# Altium project Industrial_Gateway_Academic.PrjPcb (part 1 of 2)
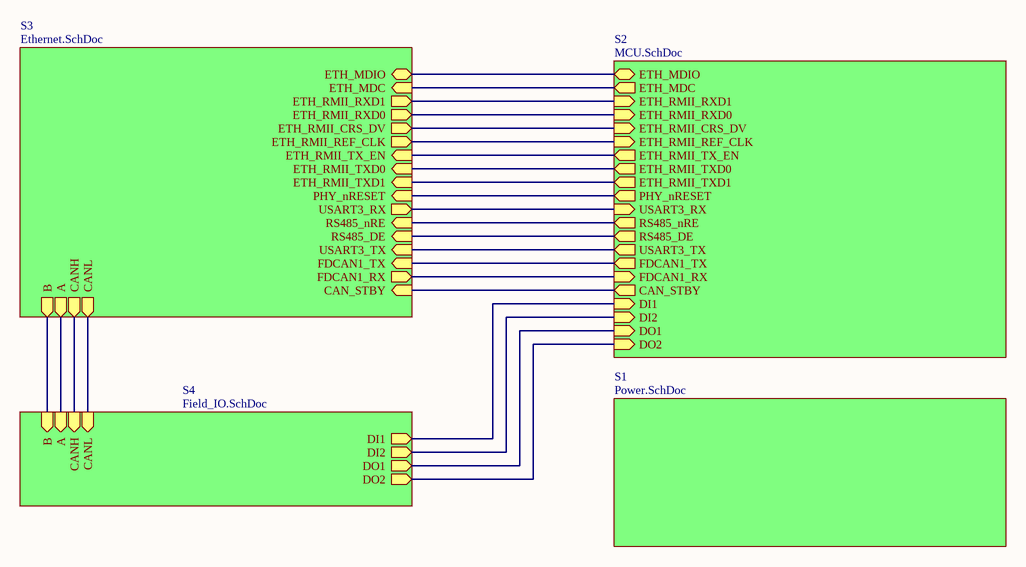
[diagram p0: TopLevel.SchDoc]
5 sheets, 136 parts. Net scope: hierarchical (ports join the sheet entries above them; power ports are global).
Board file: PCB1.PcbDoc
Sheets:
  TopLevel.SchDoc
    S2 = MCU.SchDoc
    S4 = Field_IO.SchDoc
    S3 = Ethernet.SchDoc
    S1 = Power.SchDoc

## Sheet TopLevel.SchDoc
size A

### Sub-sheets
S1 = Power.SchDoc: no entries
S2 = MCU.SchDoc: ETH_MDIO (bidir), ETH_MDC (out), ETH_RMII_RXD1 (in), ETH_RMII_RXD0 (in), ETH_RMII_CRS_DV (in), ETH_RMII_REF_CLK (in), ETH_RMII_TX_EN (out), ETH_RMII_TXD0 (out), ETH_RMII_TXD1 (out), PHY_nRESET (out), USART3_RX (in), RS485_nRE (out), RS485_DE (out), USART3_TX (out), FDCAN1_TX (out), FDCAN1_RX (in), CAN_STBY (out), DI1 (in), DI2 (in), DO1 (in), DO2 (in)
S3 = Ethernet.SchDoc: ETH_MDIO (bidir), ETH_MDC (in), ETH_RMII_RXD1 (out), ETH_RMII_RXD0 (out), ETH_RMII_CRS_DV (out), ETH_RMII_REF_CLK (out), ETH_RMII_TX_EN (in), ETH_RMII_TXD0 (in), ETH_RMII_TXD1 (in), PHY_nRESET (in), USART3_RX (out), RS485_nRE (in), RS485_DE (in), USART3_TX (in), FDCAN1_TX (in), FDCAN1_RX (out), CAN_STBY (in), B (out), A (out), CANH (out), CANL (out)
S4 = Field_IO.SchDoc: DI1 (out), DI2 (out), DO1 (out), DO2 (out), B (in), A (in), CANH (in), CANL (in)

### Nets
NetD4_1: sheet S4/B, sheet S3/B
NetD4_2: sheet S4/A, sheet S3/A
NetJ10_1: sheet S4/CANH, sheet S3/CANH
NetJ10_2: sheet S4/CANL, sheet S3/CANL
NetR16_1: sheet S2/RS485_nRE, sheet S3/RS485_nRE
NetR18_2: sheet S2/RS485_DE, sheet S3/RS485_DE
NetR24_2: sheet S2/DO1, sheet S4/DO1
NetR30_2: sheet S2/DO2, sheet S4/DO2
NetU4_3: sheet S2/DI1, sheet S4/DI1
NetU4_4: sheet S2/DI2, sheet S4/DI2
NetU4_5: sheet S2/PHY_nRESET, sheet S3/PHY_nRESET
NetU4_16: sheet S2/ETH_MDC, sheet S3/ETH_MDC
NetU4_23: sheet S2/ETH_RMII_REF_CLK, sheet S3/ETH_RMII_REF_CLK
NetU4_24: sheet S2/ETH_MDIO, sheet S3/ETH_MDIO
NetU4_31: sheet S2/ETH_RMII_CRS_DV, sheet S3/ETH_RMII_CRS_DV
NetU4_32: sheet S2/ETH_RMII_RXD0, sheet S3/ETH_RMII_RXD0
NetU4_33: sheet S2/ETH_RMII_RXD1, sheet S3/ETH_RMII_RXD1
NetU4_37: sheet S2/CAN_STBY, sheet S3/CAN_STBY
NetU4_47: sheet S2/ETH_RMII_TX_EN, sheet S3/ETH_RMII_TX_EN
NetU4_51: sheet S2/ETH_RMII_TXD0, sheet S3/ETH_RMII_TXD0
NetU4_52: sheet S2/ETH_RMII_TXD1, sheet S3/ETH_RMII_TXD1
NetU4_55: sheet S2/USART3_TX, sheet S3/USART3_TX
NetU4_56: sheet S2/USART3_RX, sheet S3/USART3_RX
NetU4_81: sheet S2/FDCAN1_RX, sheet S3/FDCAN1_RX
NetU4_82: sheet S2/FDCAN1_TX, sheet S3/FDCAN1_TX

## Sheet MCU.SchDoc
size A4
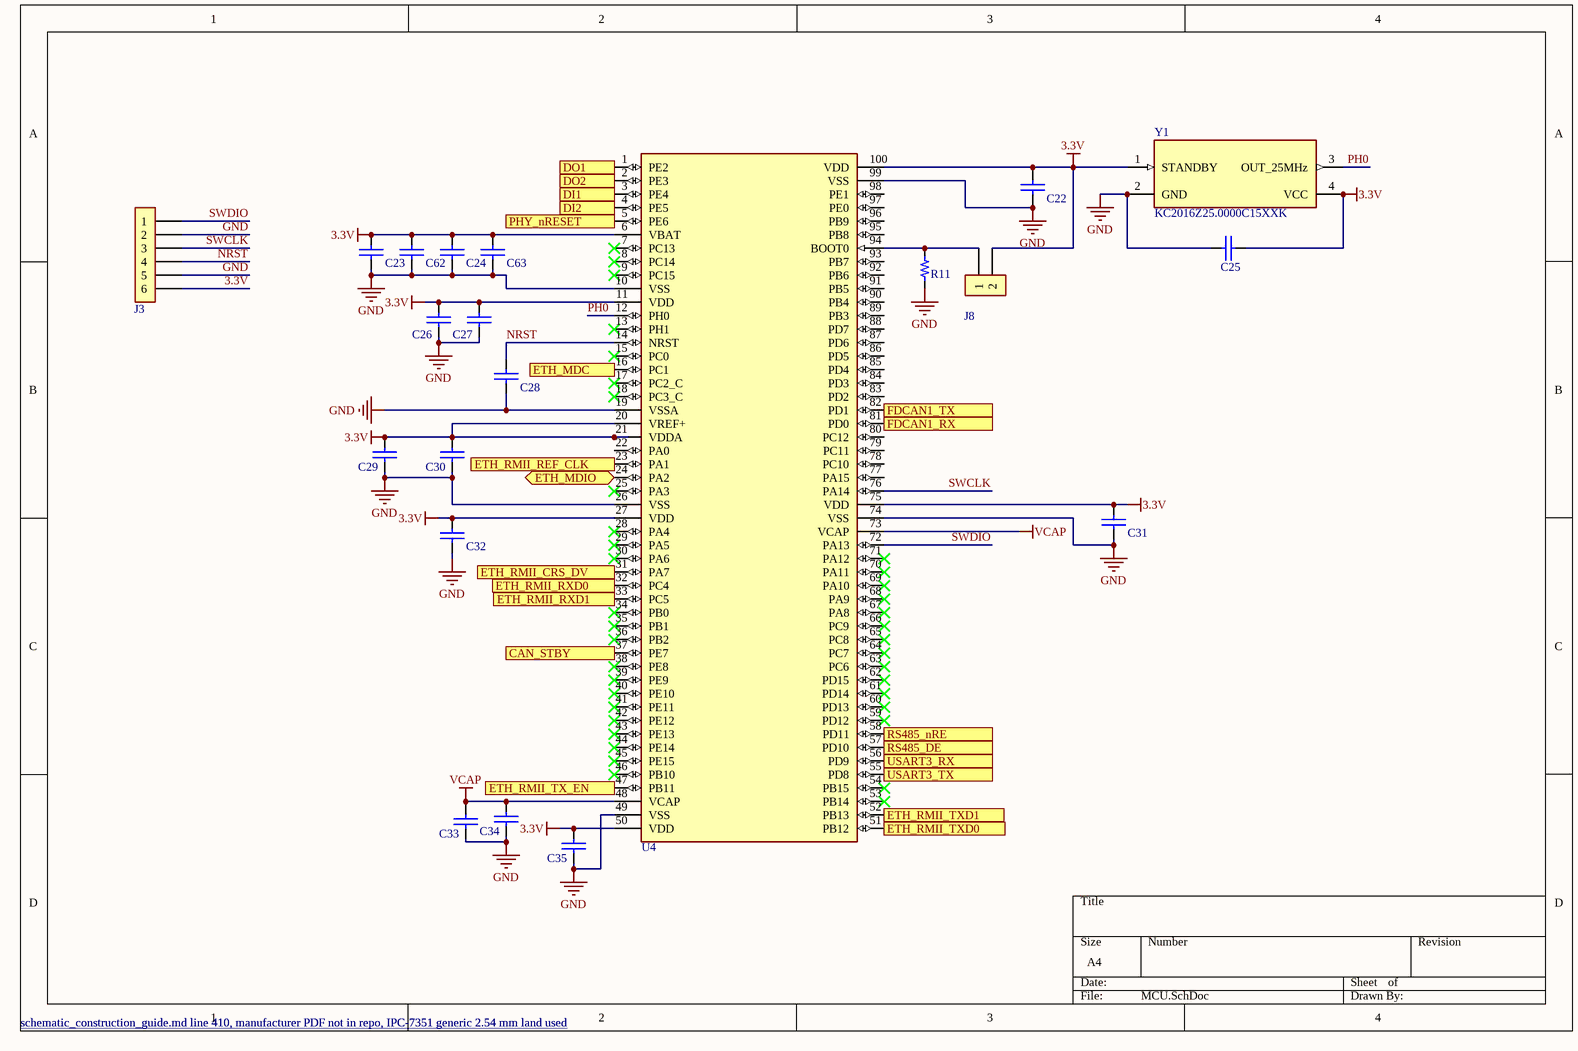
[diagram p1: MCU.SchDoc]

### Parts
C22  100 nF  [GW_0603_KEMET_NOMINAL]  (value not drawn)
C23  1 uF  [GW_SAMSUNG_CL10_1608_REFLOW]  (value not drawn)
C24  100 nF  [GW_0603_KEMET_NOMINAL]  (value not drawn)
C25  10 nF  [GW_0603_KEMET_NOMINAL]  (value not drawn)
C26  100 nF  [GW_0603_KEMET_NOMINAL]  (value not drawn)
C27  4.7 uF  [GW_0805_KEMET_NOMINAL]  (value not drawn)
C28  100 nF  [GW_0603_KEMET_NOMINAL]  (value not drawn)
C29  1 uF  [GW_SAMSUNG_CL10_1608_REFLOW]  (value not drawn)
C30  100 nF  [GW_0603_KEMET_NOMINAL]  (value not drawn)
C31  100 nF  [GW_0603_KEMET_NOMINAL]  (value not drawn)
C32  100 nF  [GW_0603_KEMET_NOMINAL]  (value not drawn)
C33  2.2 uF  [GW_0603_KEMET_NOMINAL]  (value not drawn)
C34  2.2 uF  [GW_0603_KEMET_NOMINAL]  (value not drawn)
C35  100 nF  [GW_0603_KEMET_NOMINAL]  (value not drawn)
C62  1 uF  [GW_SAMSUNG_CL10_1608_REFLOW]  (value not drawn)
C63  100 nF  [GW_0603_KEMET_NOMINAL]  (value not drawn)
J3  Source: schematic_construction_guide.md line 410, manufacturer PDF not in repo, IPC-7351 generic 2.54 mm land used  [GW_WRPHD_6X1_254_WURTH]  (hidden comment: 6 posiciones)
J8  Source: schematic_construction_guide.md line 410, manufacturer PDF not in repo, IPC-7351 generic 2.54 mm land used  [GW_WRPHD_2X1_254_WURTH]  (hidden comment: 2 posiciones)
R11  10 kOhm  [GW_RC0603_YAGEO_REFLOW]  (value not drawn)
U4  STM32H723VET6  [GW_LQFP100_ST_1L]  (value not drawn)
Y1  KC2016Z25.0000C15XXK  [GW_KC2016Z_KYOCERA]

### Ports
CAN_STBY (out), DI1 (in), DI2 (in), DO1 (in), DO2 (in), ETH_MDC (out), ETH_MDIO (bidir), ETH_RMII_CRS_DV (in), ETH_RMII_REF_CLK (in), ETH_RMII_RXD0 (in), ETH_RMII_RXD1 (in), ETH_RMII_TX_EN (out), ETH_RMII_TXD0 (out), ETH_RMII_TXD1 (out), FDCAN1_RX (in), FDCAN1_TX (out), PHY_nRESET (out), RS485_DE (out), RS485_nRE (out), USART3_RX (in), USART3_TX (out)

### Nets
3.3V: C22.1 C23.1 C24.1 C25.2 C26.1 C27.1 C29.1 C30.1 C31.1 C32.1 C35.1 C62.1 C63.1 J3.6 J8.2 U4.6(VBAT) U4.11(VDD) U4.20(VREF+) U4.21(VDDA) U4.27(VDD) U4.50(VDD) U4.75(VDD) U4.100(VDD) Y1.1(STANDBY) Y1.4(VCC)
GND: C22.2 C23.2 C24.2 C25.1 C26.2 C27.2 C28.2 C29.2 C30.2 C31.2 C32.2 C33.2 C34.2 C35.2 C62.2 C63.2 J3.2 J3.5 R11.2 U4.10(VSS) U4.19(VSSA) U4.26(VSS) U4.49(VSS) U4.74(VSS) U4.99(VSS) Y1.2(GND)
VCAP: C33.1 C34.1 U4.48(VCAP) U4.73(VCAP)
NRST: C28.1 J3.4 U4.14(NRST)
PH0: U4.12(PH0) Y1.3(OUT_25MHz)
SWCLK: J3.3 U4.76(PA14)
SWDIO: J3.1 U4.72(PA13)
NetJ8_1: J8.1 R11.1 U4.94(BOOT0)
NetR16_1: U4.58(PD11) ; port RS485_nRE
NetR18_2: U4.57(PD10) ; port RS485_DE
NetR24_2: U4.1(PE2) ; port DO1
NetR30_2: U4.2(PE3) ; port DO2
NetU4_3: U4.3(PE4) ; port DI1
NetU4_4: U4.4(PE5) ; port DI2
NetU4_5: U4.5(PE6) ; port PHY_nRESET
NetU4_16: U4.16(PC1) ; port ETH_MDC
NetU4_23: U4.23(PA1) ; port ETH_RMII_REF_CLK
NetU4_24: U4.24(PA2) ; port ETH_MDIO
NetU4_31: U4.31(PA7) ; port ETH_RMII_CRS_DV
NetU4_32: U4.32(PC4) ; port ETH_RMII_RXD0
NetU4_33: U4.33(PC5) ; port ETH_RMII_RXD1
NetU4_37: U4.37(PE7) ; port CAN_STBY
NetU4_47: U4.47(PB11) ; port ETH_RMII_TX_EN
NetU4_51: U4.51(PB12) ; port ETH_RMII_TXD0
NetU4_52: U4.52(PB13) ; port ETH_RMII_TXD1
NetU4_55: U4.55(PD8) ; port USART3_TX
NetU4_56: U4.56(PD9) ; port USART3_RX
NetU4_81: U4.81(PD0) ; port FDCAN1_RX
NetU4_82: U4.82(PD1) ; port FDCAN1_TX

Not connected (* = marked no-connect by the designer): U4 7(PC13)* 8(PC14)* 9(PC15)* 13(PH1)* 15(PC0)* 17(PC2_C)* 18(PC3_C)* 22(PA0) 25(PA3)* 28(PA4)* 29(PA5)* 30(PA6)* 34(PB0)* 35(PB1)* 36(PB2)* 38(PE8)* 39(PE9)* 40(PE10)* 41(PE11)* 42(PE12)* 43(PE13)* 44(PE14)* 45(PE15)* 46(PB10)* 53(PB14)* 54(PB15)* 59(PD12)* 60(PD13)* 61(PD14)* 62(PD15)* 63(PC6)* 64(PC7)* 65(PC8)* 66(PC9)* 67(PA8)* 68(PA9)* 69(PA10)* 70(PA11)* 71(PA12)* 77(PA15) 78(PC10) 79(PC11) 80(PC12) 83(PD2) 84(PD3) 85(PD4) 86(PD5) 87(PD6) 88(PD7) 89(PB3) 90(PB4) 91(PB5) 92(PB6) 93(PB7) 95(PB8) 96(PB9) 97(PE0) 98(PE1)

### Library data of the parts
C22 C24 C26 C28 C30-C32 C35 C63 = GW_C0603C104K5RACTU_dc5e12a5: C0603C104K5RACTU; 100 nF; 50 V; X7R; -55..125 C; CAD_CANDIDATE; Manufacturer: KEMET; Tolerance: 10%; Electrical_Status: PROVISIONAL; CAD_Source: Professor_shared.SchLib glyph Cap_0.1uF_0603_50V; CAD_Limitations: Glyph pins/types inspected; exact manufacturer land-pattern/mask/paste qualification pending.; Electrical_Notes: Ficha KEMET local p1. Adaptar parametros; no usar el Y5V 0603F104Z500CT como equivalente. Modelo candidato existente; sin cotejo visual de pads/pines en Altium.; Manufacturer Part Number: C0603C104K5RACTU; Value: 100 nF; Rating: 50 V; X7R; -55..125 C; Power Rating: N/A; Package: 0603; CAD_Status: CAD_CANDIDATE
C23 C29 C62 = GW_CL10A105KB8NNNC_c3932faa: CL10A105KB8NNNC; 1 uF; 50 V; X5R; -55..85 C; CAD_CANDIDATE; Manufacturer: Samsung Electro-Mechanics; Tolerance: 10%; Electrical_Status: PROVISIONAL; CAD_Source: Professor_shared.SchLib glyph Cap_1uF_0603_50V; CAD_Limitations: Glyph pins/types inspected; exact manufacturer land-pattern/mask/paste qualification pending.; Electrical_Notes: Samsung ficha oficial; Ceff/ESR pendientes por aplicacion. Limite X5R 85 C: no homologado para ambiente superior. Modelo candidato existente; sin cotejo visual de pads/pines en Altium.; Manufacturer Part Number: CL10A105KB8NNNC; Value: 1 uF; Rating: 50 V; X5R; -55..85 C; Power Rating: N/A; Package: 0603; CAD_Status: CAD_CANDIDATE
C25 = GW_C0603C103K1RACTU_97f3ee33: C0603C103K1RACTU; 10 nF; 100 V; X7R; -55..125 C; CAD_CANDIDATE; Manufacturer: KEMET; Tolerance: 10%; Electrical_Status: PROVISIONAL; CAD_Source: Professor_shared.SchLib glyph Cap_0.1uF_0603_50V; CAD_Limitations: Glyph pins/types inspected; exact manufacturer land-pattern/mask/paste qualification pending.; Electrical_Notes: Ficha KEMET local DI_CIN p1; no confundir con externo CL10B103KA8WPNC 25 V. Modelo candidato existente; sin cotejo visual de pads/pines en Altium.; Manufacturer Part Number: C0603C103K1RACTU; Value: 10 nF; Rating: 100 V; X7R; -55..125 C; Power Rating: N/A; Package: 0603; CAD_Status: CAD_CANDIDATE
C27 = GW_C0805C475K4RACTU_82374e08: C0805C475K4RACTU; 4.7 uF; 16 V; X7R; CAD_CANDIDATE; Manufacturer: KEMET; Tolerance: 10%; Electrical_Status: PROVISIONAL; CAD_Source: Professor_shared.SchLib glyph Cap_10uF_0805_25V_; CAD_Limitations: Glyph pins/types inspected; exact manufacturer land-pattern/mask/paste qualification pending.; Electrical_Notes: Ceff a 3.3 V pendiente; no sustituir por 10 uF solo por disponibilidad. Modelo candidato existente; sin cotejo visual de pads/pines en Altium.; Manufacturer Part Number: C0805C475K4RACTU; Value: 4.7 uF; Rating: 16 V; X7R; Power Rating: N/A; Package: 0805; CAD_Status: CAD_CANDIDATE
C33 C34 = GW_C0603C225K8RACTU_46503424: C0603C225K8RACTU; 2.2 uF; 10 V; X7R; ESR <100 mOhm; CAD_CANDIDATE; Manufacturer: KEMET; Tolerance: 10% candidato; ST permite 20%; Electrical_Status: PROVISIONAL; CAD_Source: Professor_shared.SchLib glyph Cap_0.1uF_0603_50V; CAD_Limitations: Glyph pins/types inspected; exact manufacturer land-pattern/mask/paste qualification pending.; Electrical_Notes: Falta ESR y capacitancia bajo VCORE/temperatura/envejecimiento. No conectar 3.3 V ni carga externa a VCAP. Modelo candidato existente; sin cotejo visual de pads/pines en Altium.; Manufacturer Part Number: C0603C225K8RACTU; Value: 2.2 uF; Rating: 10 V; X7R; ESR <100 mOhm; Power Rating: N/A; Package: 0603; CAD_Status: CAD_CANDIDATE
J3 = GW_H_Male_6x1_TH_100mil_c0450d1e: TBD; 6 posiciones; TBD; CAD_CANDIDATE; Manufacturer: Wurth Elektronik; Manufacturer Part Number: 61300611121; Electrical_Status: PROVISIONAL; CAD_Source: Professor_shared.SchLib glyph H_Male_6x1_TH_100mil; CAD_Limitations: Glyph pins/types inspected; exact manufacturer land-pattern/mask/paste qualification pending.; Electrical_Notes: Pinout, MPN y orientacion pendientes. No alimentar VDD desde VTref; SWD PA13/PA14 y NRST. Modelo candidato existente; sin cotejo visual de pads/pines en Altium.; Value: 6 posiciones; Tolerance: TBD; Rating: TBD; Power Rating: N/A; Package: TBD; CAD_Status: CAD_CANDIDATE
J8 = GW_H_Male_2x1_TH_100mil_f89d9046: TBD; 2 posiciones; TBD; CAD_CANDIDATE; Manufacturer: Wurth Elektronik; Manufacturer Part Number: 61300211121; Electrical_Status: PROVISIONAL; CAD_Source: Professor_shared.SchLib glyph H_Male_2x1_TH_100mil; CAD_Limitations: Glyph pins/types inspected; exact manufacturer land-pattern/mask/paste qualification pending.; Electrical_Notes: Pinout, MPN y orientacion pendientes. No alimentar VDD desde VTref; SWD PA13/PA14 y NRST. Modelo candidato existente; sin cotejo visual de pads/pines en Altium.; Value: 2 posiciones; Tolerance: TBD; Rating: TBD; Power Rating: N/A; Package: TBD; CAD_Status: CAD_CANDIDATE
R11 = GW_FRC0603J103TS_7289f91d: FRC0603J103TS; 10 kOhm; >= 3.3 V; tension de trabajo por verificar; CAD_CANDIDATE; Manufacturer: FOJAN; Tolerance: 5%; Power Rating: 0.1 W; Electrical_Status: PROVISIONAL; CAD_Source: Professor_shared.SchLib glyph Res_10k_0603_1/10W; CAD_Limitations: Glyph pins/types inspected; exact manufacturer land-pattern/mask/paste qualification pending.; Electrical_Notes: Ratings transcritos del CAD; falta ficha FOJAN. Alternativa RC0603FR-0710KL con ficha oficial local, mismo footprint candidato. Modelo candidato existente; sin cotejo visual de pads/pines en Altium.; Manufacturer Part Number: FRC0603J103TS; Value: 10 kOhm; Rating: >= 3.3 V; tension de trabajo por verificar; Package: 0603; CAD_Status: CAD_CANDIDATE
U4 = STM32H723VET6: STM32H723VET6; CAD_CANDIDATE; GPIOs use bidirectional ERC type; oscillator pins have dedicated types. VCAP power pins are LDO outputs, never connect to VDD.; Manufacturer: STMicroelectronics; Electrical_Status: PROVISIONAL; CAD_Source: DS13313 Rev5 fig5, table7 pp57-71, fig65 p218 (PDF p219); Manufacturer Part Number: STM32H723VET6; Value: STM32H723VET6; CAD_Status: CAD_CANDIDATE; CAD_Limitations: GPIOs use bidirectional ERC type; oscillator pins have dedicated types. VCAP power pins are LDO outputs, never connect to VDD.
Y1 = KC2016Z25.0000C15XXK: Kyocera TNY1T-H1-DEX01-11 17-Jul-2026 pp4,6 table2 fig4; Two independent oscillators proposed; 10nF per supply. Tie1 to3V3. Load<=15pF and PHY phase-noise qualification pending.; CAD Status: CAD_CANDIDATE; Manufacturer: Kyocera; Manufacturer Part Number: KC2016Z25.0000C15XXK; Source: Kyocera TNY1T-H1-DEX01-11 17-Jul-2026 pp4,6 table2 fig4; Limitations: Two independent oscillators proposed; 10nF per supply. Tie1 to3V3. Load<=15pF and PHY phase-noise qualification pending.

## Sheet Field_IO.SchDoc
size A4
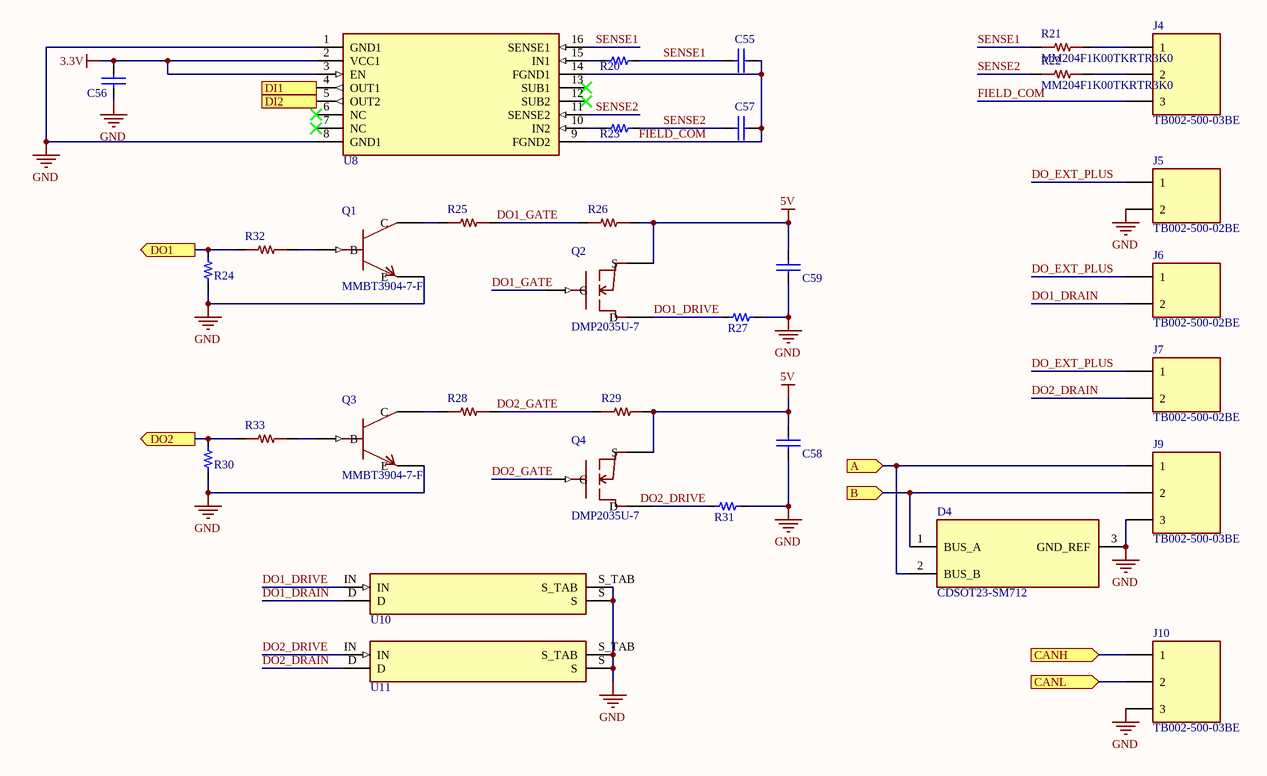
[diagram p2: Field_IO.SchDoc]

### Parts
C55  10 nF  [GW_0603_KEMET_NOMINAL]  (value not drawn)
C56  100 nF  [GW_0603_KEMET_NOMINAL]  (value not drawn)
C57  10 nF  [GW_0603_KEMET_NOMINAL]  (value not drawn)
C58  100 nF  [GW_0603_KEMET_NOMINAL]  (value not drawn)
C59  100 nF  [GW_0603_KEMET_NOMINAL]  (value not drawn)
D4  CDSOT23-SM712  [GW_SM712_BOURNS]
J4  TB002-500-03BE  [GW_TB002_500_3P_SAMESKY]
J5  TB002-500-02BE  [GW_TB002_500_2P_SAMESKY]
J6  TB002-500-02BE  [GW_TB002_500_2P_SAMESKY]
J7  TB002-500-02BE  [GW_TB002_500_2P_SAMESKY]
J9  TB002-500-03BE  [GW_TB002_500_3P_SAMESKY]
J10  TB002-500-03BE  [GW_TB002_500_3P_SAMESKY]
Q1  MMBT3904-7-F  [GW_MMBT3904_BEC_DIODES]
Q2  DMP2035U-7  [GW_DMP2035U_GSD_DIODES]
Q3  MMBT3904-7-F  [GW_MMBT3904_BEC_DIODES]
Q4  DMP2035U-7  [GW_DMP2035U_GSD_DIODES]
R20  562 Ohm  [GW_RC0603_YAGEO_REFLOW]  (value not drawn)
R21  MM204F1K00TKRTR3K0  [GW_MM204_FIRSTOHM]
R22  MM204F1K00TKRTR3K0  [GW_MM204_FIRSTOHM]
R23  562 Ohm  [GW_RC0603_YAGEO_REFLOW]  (value not drawn)
R24  10 kOhm  [GW_RC0603_YAGEO_REFLOW]  (value not drawn)
R25  RC0603FR-07100RL  [GW_RC0603_YAGEO_REFLOW]  (value not drawn)
R26  RC0603FR-074K7L  [GW_RC0603_YAGEO_REFLOW]  (value not drawn)
R27  2.49 kOhm  [GW_RC0603_YAGEO_REFLOW]  (value not drawn)
R28  RC0603FR-07100RL  [GW_RC0603_YAGEO_REFLOW]  (value not drawn)
R29  RC0603FR-074K7L  [GW_RC0603_YAGEO_REFLOW]  (value not drawn)
R30  10 kOhm  [GW_RC0603_YAGEO_REFLOW]  (value not drawn)
R31  2.49 kOhm  [GW_RC0603_YAGEO_REFLOW]  (value not drawn)
R32  RC0603FR-074K7L  [GW_RC0603_YAGEO_REFLOW]  (value not drawn)
R33  RC0603FR-074K7L  [GW_RC0603_YAGEO_REFLOW]  (value not drawn)
U8  ISO1212DBQR  [GW_DBQ0016A_TI]  (value not drawn)
U10  BSP75NTA  [GW_BSP75N_SOT223_DN_DIODES]  (value not drawn)
U11  BSP75NTA  [GW_BSP75N_SOT223_DN_DIODES]  (value not drawn)

### Ports
A (in), B (in), CANH (in), CANL (in), DI1 (out), DI2 (out), DO1 (out), DO2 (out)

### Nets
3.3V: C56.1 U8.2(VCC1) U8.3(EN)
5V: C58.1 C59.1 Q2.S Q4.S R26.2 R29.2
GND: C56.2 C58.2 C59.2 D4.3(GND_REF) J5.2 J9.3 J10.3 Q1.E Q3.E R24.1 R27.2 R30.1 R31.2 U8.1(GND1) U8.8(GND1) U10.S U10.S_TAB U11.S U11.S_TAB
DO1_DRAIN: J6.2 U10.D
DO1_DRIVE: Q2.D R27.1 U10.IN
DO1_GATE: Q2.G R25.2 R26.1
DO2_DRAIN: J7.2 U11.D
DO2_DRIVE: Q4.D R31.1 U11.IN
DO2_GATE: Q4.G R28.2 R29.1
DO_EXT_PLUS: J5.1 J6.1 J7.1
FIELD_COM: C55.2 C57.2 J4.3 U8.9(FGND2) U8.14(FGND1)
SENSE1: C55.1 R20.2 R21.1 U8.16(SENSE1)
SENSE2: C57.1 R22.1 R23.2 U8.11(SENSE2)
NetD4_1: D4.1(BUS_A) J9.2 ; port B
NetD4_2: D4.2(BUS_B) J9.1 ; port A
NetJ4_1: J4.1 R21.2
NetJ4_2: J4.2 R22.2
NetJ10_1: J10.1 ; port CANH
NetJ10_2: J10.2 ; port CANL
NetQ1_B: Q1.B R32.2
NetQ1_C: Q1.C R25.1
NetQ3_B: Q3.B R33.2
NetQ3_C: Q3.C R28.1
NetR20_1: R20.1 U8.15(IN1)
NetR23_1: R23.1 U8.10(IN2)
NetR24_2: R24.2 R32.1 ; port DO1
NetR30_2: R30.2 R33.1 ; port DO2
NetU4_3: U8.4(OUT1) ; port DI1
NetU4_4: U8.5(OUT2) ; port DI2

Not connected (* = marked no-connect by the designer): U8 6(NC)* 7(NC)* 12(SUB2)* 13(SUB1)*

### Library data of the parts
C55 C57 = GW_C0603C103K1RACTU_97f3ee33: as C25 on sheet MCU; Manufacturer Part Number: C0603C103K1RACTU; Value: 10 nF; Rating: 100 V; X7R; -55..125 C; Power Rating: N/A; Package: 0603; CAD_Status: CAD_CANDIDATE
C56 C58 C59 = GW_C0603C104K5RACTU_dc5e12a5: as C22 on sheet MCU; Manufacturer Part Number: C0603C104K5RACTU; Value: 100 nF; Rating: 50 V; X7R; -55..125 C; Power Rating: N/A; Package: 0603; CAD_Status: CAD_CANDIDATE
D4 = CDSOT23-SM712: Bourns CDSOT23-SM712 saved2026-11-07 pp1-2 pin diagram and Recommended Footprint; CAD mapping supported; no transferred 1kV surge rating for THVD1420. Populate only after protection qualification.; CAD Status: CAD_CANDIDATE; Manufacturer: Bourns; Manufacturer Part Number: CDSOT23-SM712; Source: Bourns CDSOT23-SM712 saved2026-11-07 pp1-2 pin diagram and Recommended Footprint; Limitations: CAD mapping supported; no transferred 1kV surge rating for THVD1420. Populate only after protection qualification.
J4 J9 J10 = TB002-500-03BE: Same Sky TB002-500 Rev1.04 09/12/2024 p1 order key,p2 PCB layout; project contact1left in PCBtopview with wire entry facing-Y;not manufacturer polarity; Manufacturer: Same Sky (formerly CUI Devices); Value: 3-pole5mm terminal block; CAD Status: CAD_VERIFIED_GEOMETRY;NATIVE_PLACEMENT_PENDING; Electrical Status: DERIVED_PENDING_REVIEW; Physical Mapping: Project-defined1left then+X in PCBtopview; wire-entryfront-Y. Confirm wire polarity against silk before bringup.; Manufacturer Part Number: TB002-500-03BE; Source: Same Sky TB002-500 Rev1.04 09/12/2024 p1 order key,p2 PCB layout; Datasheet: sources/autonomous_closure/tb002-500.pdf
J5-J7 = TB002-500-02BE: Same Sky TB002-500 Rev1.04 09/12/2024 p1 order key,p2 PCB layout; project contact1left in PCBtopview with wire entry facing-Y;not manufacturer polarity; Manufacturer: Same Sky (formerly CUI Devices); Value: 2-pole5mm terminal block; CAD Status: CAD_VERIFIED_GEOMETRY;NATIVE_PLACEMENT_PENDING; Electrical Status: DERIVED_PENDING_REVIEW; Physical Mapping: Project-defined1left then+X in PCBtopview; wire-entryfront-Y. Confirm wire polarity against silk before bringup.; Manufacturer Part Number: TB002-500-02BE; Source: Same Sky TB002-500 Rev1.04 09/12/2024 p1 order key,p2 PCB layout; Datasheet: sources/autonomous_closure/tb002-500.pdf
Q1 Q3 = MMBT3904-7-F: Diodes DS30036 Rev27-2 March2025 p1 top view/order, p3 electrical, p6 suggested lands; conventional NPN symbol; used in5V BSP input driver,NOT24V load path; Manufacturer: Diodes Incorporated; Value: NPN 40V200mA; CAD Status: CAD_VERIFIED_GEOMETRY;NATIVE_PLACEMENT_PENDING; Electrical Status: DERIVED_PENDING_REVIEW; Manufacturer Part Number: MMBT3904-7-F; Source: Diodes DS30036 Rev27-2 March2025 p1 top view/order, p3 electrical, p6 suggested lands; Datasheet: sources/autonomous_closure/MMBT3904.pdf; Terminal Mapping: Top view tab/lead above C/D; lower-left B/G; lower-right E/S; manufacturer functional IDs, no guessed numbers
Q2 Q4 = DMP2035U-7: Diodes DS31830 Rev11-2 June2025 p1 top view/order,p2 electrical,p6 suggested lands; conventional PMOS symbol; used in5V BSP input driver,NOT24V load path; Manufacturer: Diodes Incorporated; Value: PMOS20V;VGS±10V; CAD Status: CAD_VERIFIED_GEOMETRY;NATIVE_PLACEMENT_PENDING; Electrical Status: DERIVED_PENDING_REVIEW; Manufacturer Part Number: DMP2035U-7; Source: Diodes DS31830 Rev11-2 June2025 p1 top view/order,p2 electrical,p6 suggested lands; Datasheet: sources/autonomous_closure/DMP2035U.pdf; Terminal Mapping: Top view tab/lead above C/D; lower-left B/G; lower-right E/S; manufacturer functional IDs, no guessed numbers
R20 R23 = GW_RC0603FR-07562RL_a6fad8df: RC0603FR-07562RL; 562 Ohm; 75 V max; limite sqrt(P*R); CAD_CANDIDATE; Manufacturer: Yageo; Tolerance: 1%; Power Rating: 0.1 W @70 C; Electrical_Status: PROVISIONAL; CAD_Source: Professor_shared.SchLib glyph Res_10k_0603_1/10W; CAD_Limitations: Glyph pins/types inspected; exact manufacturer land-pattern/mask/paste qualification pending.; Electrical_Notes: Ityp2.25mA; P conservadora a2.75mA=4.30mW. No es resistor de24V completos; corriente de campo separada deVCC1. Modelo candidato existente; sin cotejo visual de pads/pines en Altium.; Manufacturer Part Number: RC0603FR-07562RL; Value: 562 Ohm; Rating: 75 V max; limite sqrt(P*R); Package: 0603; CAD_Status: CAD_CANDIDATE
R21 R22 = MM204F1K00TKRTR3K0: MM204F1K00TKRTR3K0; CAD_VERIFIED_GEOMETRY; Saved1.3x1.6landsatx+/-1.45mmmatchmanufacturerreflowtable. Nonpolar1/2projectmappingverified. NormalDIType3applicationonly;no500V/1kVsurgequalificationinferredfromMELFor0.25W. NativeDIresistornetsmustbecorrected.; Manufacturer: Firstohm; CAD Status: CAD_CANDIDATE; Limitations: 1kOhm1%,0.25W@70C, normal Type3 operation supported. 500V/1kV system surge withstand NOT established.; Manufacturer Part Number: MM204F1K00TKRTR3K0; Source: Firstohm MM rev08-March-2023 printedpp75-78, p78 reflow pad table MM16/MM204
R24 R30 = GW_FRC0603J103TS_7289f91d: as R11 on sheet MCU; Manufacturer Part Number: FRC0603J103TS; Value: 10 kOhm; Rating: >= 3.3 V; tension de trabajo por verificar; Package: 0603; CAD_Status: CAD_CANDIDATE
R25 R28 = RC0603FR-07100RL: RC0603FR-07100RL;1%0.1W75V0603; manufacturer RCseries ordering;Yageo mounting13Feb2018V10p4; Value: 100 Ohm; CAD Status: CAD_VERIFIED_GEOMETRY;NATIVE_PLACEMENT_PENDING; Electrical Status: DERIVED_PENDING_REVIEW;ORDER_CODE_FAMILY_SUPPORTED;EXACT_NOMINAL_SHEET_PENDING; Tolerance: 1%; Voltage Rating: 75V or sqrt(P*R),whichever lower; Power Rating: 0.1W at70C; Manufacturer: Yageo; Manufacturer Part Number: RC0603FR-07100RL; Source: Yageo RC0603 series order coding; Mounting13Feb2018V10 p4 Fig4/Table1; Package: 0603
R26 R29 R32 R33 = RC0603FR-074K7L: RC0603FR-074K7L;1%0.1W75V0603; manufacturer RCseries ordering;Yageo mounting13Feb2018V10p4; Value: 4.7 kOhm; CAD Status: CAD_VERIFIED_GEOMETRY;NATIVE_PLACEMENT_PENDING; Electrical Status: DERIVED_PENDING_REVIEW;ORDER_CODE_FAMILY_SUPPORTED;EXACT_NOMINAL_SHEET_PENDING; Tolerance: 1%; Voltage Rating: 75V or sqrt(P*R),whichever lower; Power Rating: 0.1W at70C; Manufacturer: Yageo; Manufacturer Part Number: RC0603FR-074K7L; Source: Yageo RC0603 series order coding; Mounting13Feb2018V10 p4 Fig4/Table1; Package: 0603
R27 R31 = GW_RC0603FR-072K49L_b905c5f0: RC0603FR-072K49L; 2.49 kOhm; 75 V max; limite sqrt(P*R); CAD_CANDIDATE; Manufacturer: Yageo; Tolerance: 1%; Power Rating: 0.1 W @70 C; CAD_Status: CAD_VERIFIED_SOURCE_LAND;NATIVE_INSTANCE_ECO_PENDING; Electrical_Status: PROVISIONAL; CAD_Source: Professor_shared.SchLib glyph Res_10k_0603_1/10W; CAD_Limitations: Same-manufacturer series mounting geometry verified; prototype mask/paste choices recorded. Electrical application limits unchanged. Native instance links/ECO pending.; Electrical_Notes: Candidato ENHANCED/RMII leader: ModeSelect NC, strap1=1 default, strap8=1, strap5=0 default. Ver tabla del informe; sin LEDs de straps. Modelo candidato existente; sin cotejo visual de pads/pines en Altium.; Manufacturer Part Number: RC0603FR-072K49L; Value: 2.49 kOhm; Rating: 75 V max; limite sqrt(P*R); Package: 0603
U8 = ISO1212DBQR: ISO1212DBQR; CAD_CANDIDATE; SUB12 and SUB13 must remain separate floating nets. TI recommends an individual 2x2mm floating copper island for each; these board-level islands are NOT encoded in this package footprint. Never join to either FGND, GND1 or each; Manufacturer: Texas Instruments; Electrical_Status: PROVISIONAL; CAD_Source: SLLSEY7G table4-2 p4; DBQ0016A 4214846/A PDF pp44-46; CAD_Limitations: SUB12 and SUB13 must remain separate floating nets. TI recommends an individual 2x2mm floating copper island for each; these board-level islands are NOT encoded in this package footprint. Never join to either FGND, GND1 or each other. NC6/7 unconnected.; Manufacturer Part Number: ISO1212DBQR; Value: ISO1212DBQR; CAD_Status: CAD_CANDIDATE
U10 U11 = BSP75NTA: BSP75NTA smart low-side switch; physical terminal positions and Diodes land pattern verified; IN,D,S,S_TAB identifiers; driver VOH acceptance remains pending.; Manufacturer: Diodes Incorporated; CAD_Status: CAD_BLOCKED; Electrical_Status: PROVISIONAL; CAD_Source: Diodes DS33016 Rev7-2 pp1,8; terminal numbering absent; CAD_Limitations: CAD_BLOCKED: terminal identifiers are role names, not manufacturer numbers. Tab=Source, isolated from Drain. Need exact numbered Type DN drawing/model before any placement or footprint binding.; CAD Status: CAD_VERIFIED; Limitations: Physical mapping verified from Diodes top view: with tab above, left IN, middle D, right S; tab S_TAB=Source. No manufacturer numeric pin IDs asserted. Loaded driver VOH and startup OFF not yet verified.; Electrical Approval: ELECTRICAL_BLOCKED_DRIVER_VOLTAGE_PENDING; Physical Mapping: IN left lower;D center lower;S right lower;S_TAB upper tab;Top View; Manufacturer Part Number: BSP75NTA; Value: BSP75NTA; Source: Diodes DS33016 Rev7-2 Jan2024 p1 Top View Pin Out, p8 Suggested Pad Layout; functional pad identifiers preserve original symbol pins; Datasheet: sources/bsp75n_closure/BSP75N.pdf

## Sheet Ethernet.SchDoc
size A3
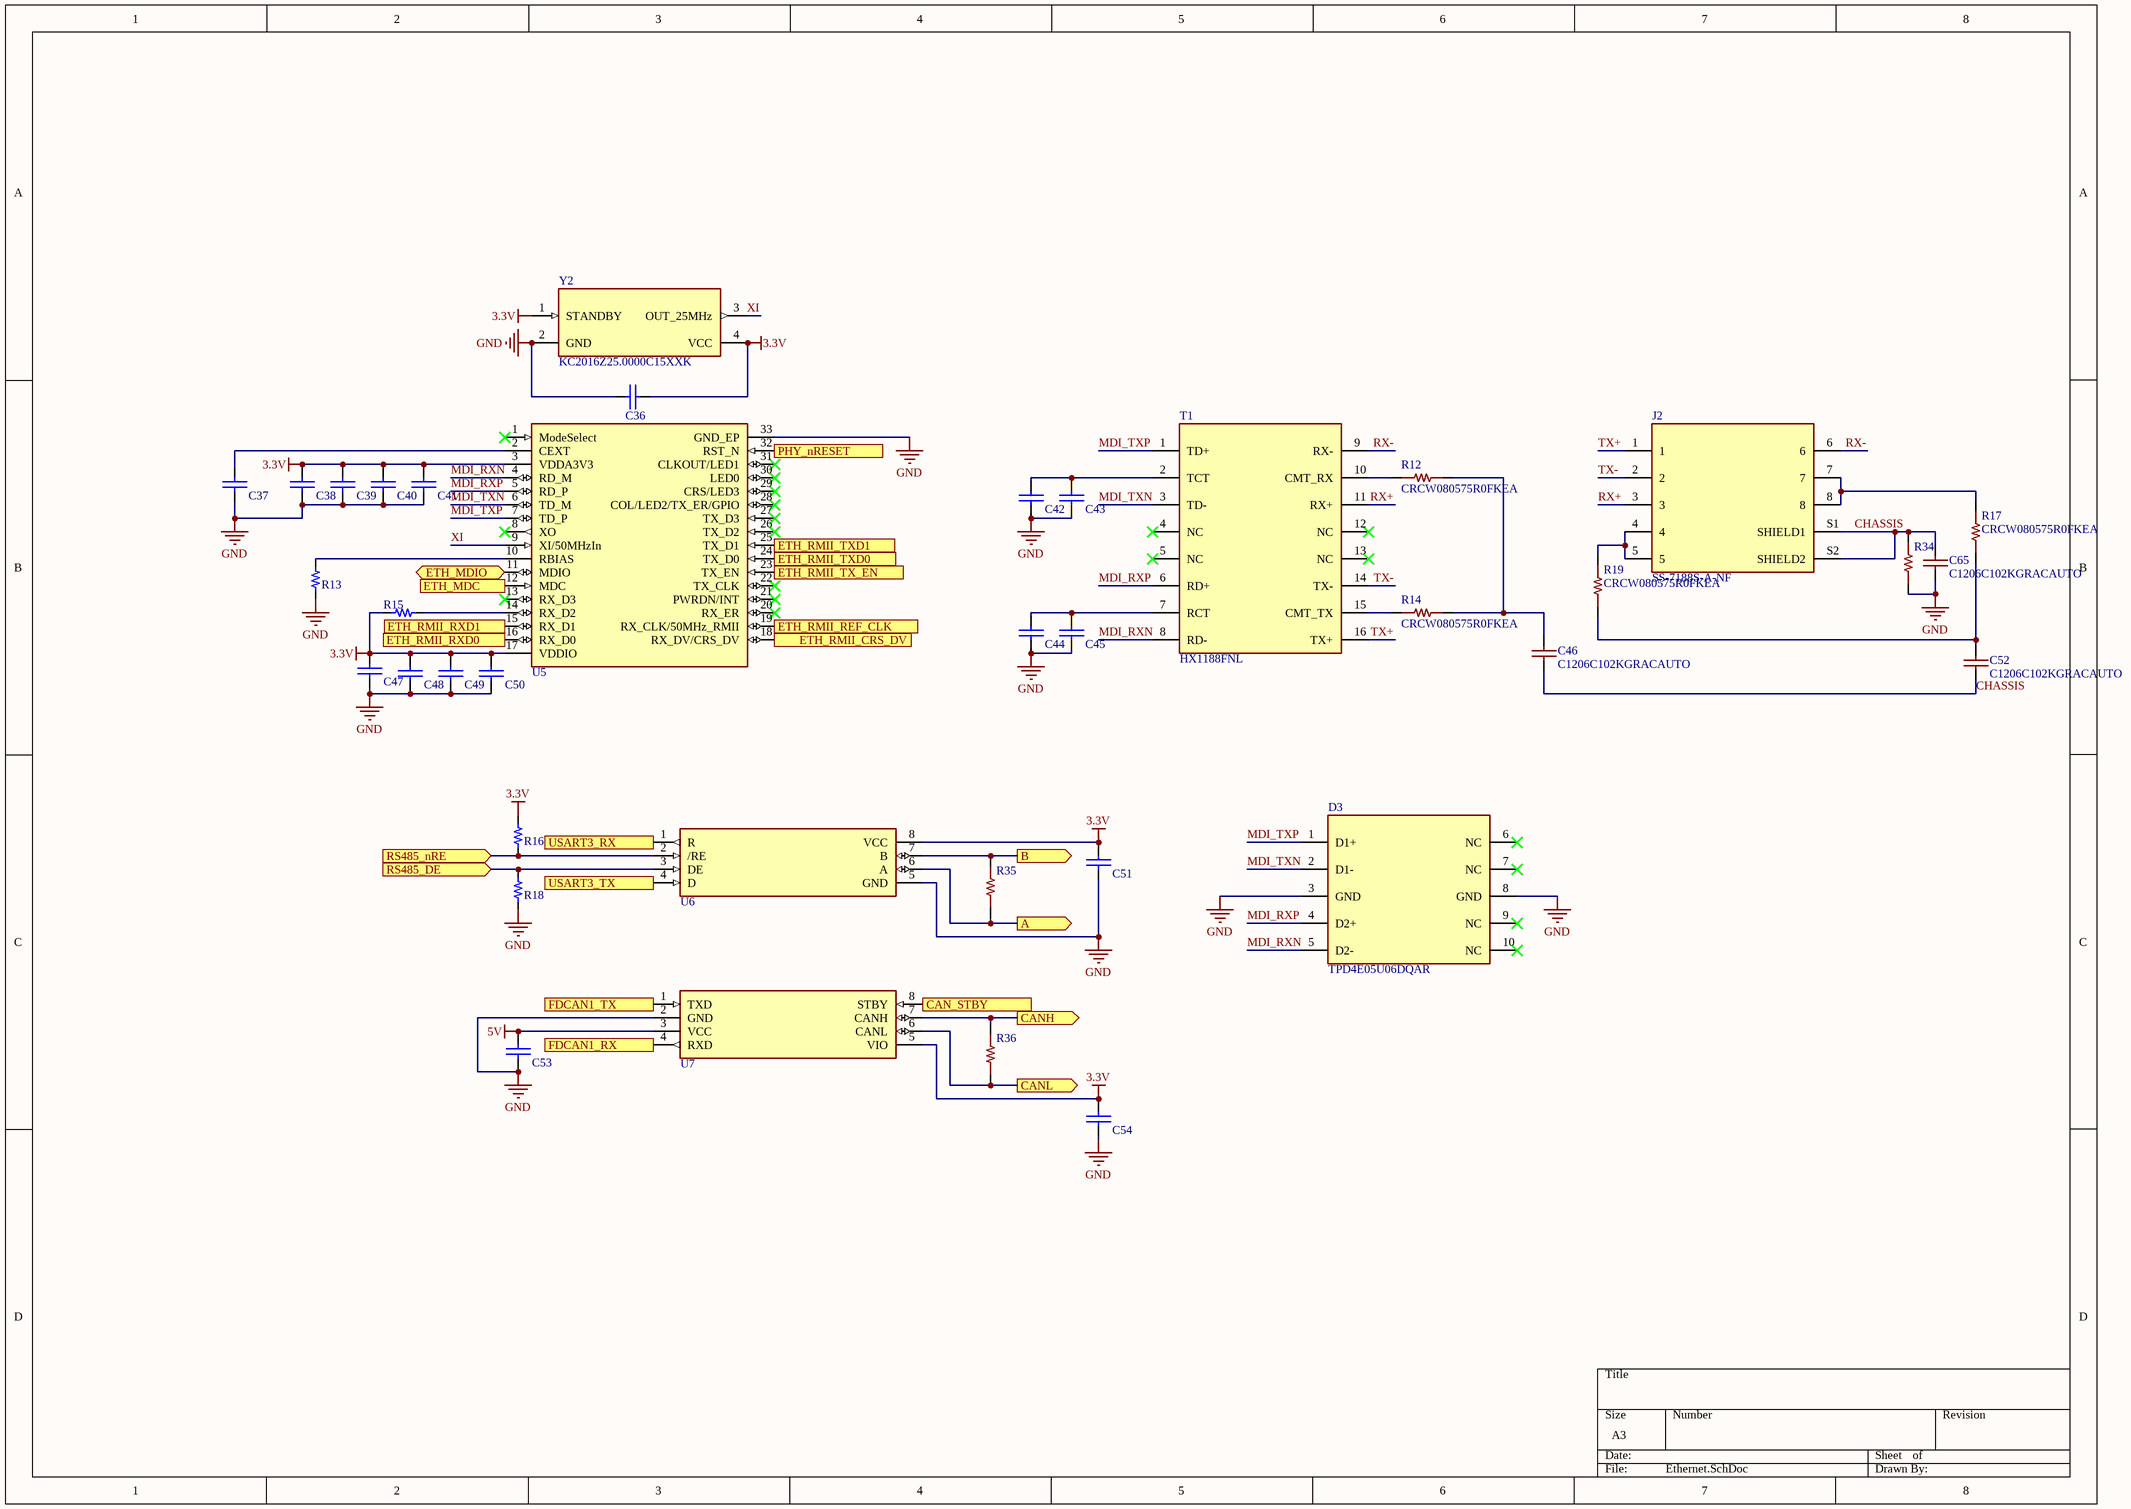
[diagram p3: Ethernet.SchDoc]

### Parts
C36  10 nF  [GW_0603_KEMET_NOMINAL]  (value not drawn)
C37  2 nF  [GW_0603_KEMET_NOMINAL]  (value not drawn)
C38  10 nF  [GW_0603_KEMET_NOMINAL]  (value not drawn)
C39  100 nF  [GW_0603_KEMET_NOMINAL]  (value not drawn)
C40  1 uF  [GW_SAMSUNG_CL10_1608_REFLOW]  (value not drawn)
C41  10 uF  [GW_SAMSUNG_CL21_2012_REFLOW]  (value not drawn)
C42  100 nF  [GW_0603_KEMET_NOMINAL]  (value not drawn)
C43  100 nF  [GW_0603_KEMET_NOMINAL]  (value not drawn)
C44  100 nF  [GW_0603_KEMET_NOMINAL]  (value not drawn)
C45  100 nF  [GW_0603_KEMET_NOMINAL]  (value not drawn)
C46  C1206C102KGRACAUTO  [GW_C1206_KEMET_C1076_DENSITY_B]
C47  10 nF  [GW_0603_KEMET_NOMINAL]  (value not drawn)
C48  100 nF  [GW_0603_KEMET_NOMINAL]  (value not drawn)
C49  1 uF  [GW_SAMSUNG_CL10_1608_REFLOW]  (value not drawn)
C50  10 uF  [GW_SAMSUNG_CL21_2012_REFLOW]  (value not drawn)
C51  100 nF  [GW_0603_KEMET_NOMINAL]  (value not drawn)
C52  C1206C102KGRACAUTO  [GW_C1206_KEMET_C1076_DENSITY_B]
C53  100 nF  [GW_0603_KEMET_NOMINAL]  (value not drawn)
C54  100 nF  [GW_0603_KEMET_NOMINAL]  (value not drawn)
C65  C1206C102KGRACAUTO  [GW_C1206_KEMET_C1076_DENSITY_B]
D3  TPD4E05U06DQAR  [GW_DQA0010A_TI]
J2  SS-7188S-A-NF  [GW_SS7188SANF_STEWART]
R12  CRCW080575R0FKEA  [GW_CRCW0805_VISHAY_20035_REFLOW]
R13  6.49 kOhm  [GW_RC0603_YAGEO_REFLOW]  (value not drawn)
R14  CRCW080575R0FKEA  [GW_CRCW0805_VISHAY_20035_REFLOW]
R15  2.49 kOhm  [GW_RC0603_YAGEO_REFLOW]  (value not drawn)
R16  10 kOhm  [GW_RC0603_YAGEO_REFLOW]  (value not drawn)
R17  CRCW080575R0FKEA  [GW_CRCW0805_VISHAY_20035_REFLOW]
R18  10 kOhm  [GW_RC0603_YAGEO_REFLOW]  (value not drawn)
R19  CRCW080575R0FKEA  [GW_CRCW0805_VISHAY_20035_REFLOW]
R34  RC0603FR-071ML  [GW_RC0603_YAGEO_REFLOW]  (value not drawn)
R35  CRCW1206120RFKEA  [GW_CRCW1206_VISHAY_20035_REFLOW]  (value not drawn)
R36  CRCW1206120RFKEA  [GW_CRCW1206_VISHAY_20035_REFLOW]  (value not drawn)
T1  HX1188FNL  [GW_HX1188FNL_PULSE]
U5  DP83826IRHBR  [GW_RHB0032M_TI]  (value not drawn)
U6  THVD1420DR  [GW_SOIC8_1P27_5P4]  (value not drawn)
U7  ATA6561-GAQW  [GW_SOIC8_1P27_5P4]  (value not drawn)
Y2  KC2016Z25.0000C15XXK  [GW_KC2016Z_KYOCERA]

### Ports
A (out), B (out), CAN_STBY (in), CANH (out), CANL (out), ETH_MDC (in), ETH_MDIO (bidir), ETH_RMII_CRS_DV (out), ETH_RMII_REF_CLK (out), ETH_RMII_RXD0 (out), ETH_RMII_RXD1 (out), ETH_RMII_TX_EN (in), ETH_RMII_TXD0 (in), ETH_RMII_TXD1 (in), FDCAN1_RX (out), FDCAN1_TX (in), PHY_nRESET (in), RS485_DE (in), RS485_nRE (in), USART3_RX (out), USART3_TX (in)

### Nets
3.3V: C36.2 C38.1 C39.1 C40.1 C41.1 C47.1 C48.1 C49.1 C50.1 C51.1 C54.1 R15.1 R16.2 U5.3(VDDA3V3) U5.17(VDDIO) U6.8(VCC) U7.5(VIO) Y2.1(STANDBY) Y2.4(VCC)
5V: C53.1 U7.3(VCC)
GND: C36.1 C37.2 C38.2 C39.2 C40.2 C41.2 C42.2 C43.2 C44.2 C45.2 C47.2 C48.2 C49.2 C50.2 C51.2 C53.2 C54.2 C65.1 D3.3(GND) D3.8(GND) R13.1 R18.1 R34.1 U5.33(GND_EP) U6.5(GND) U7.2(GND) Y2.2(GND)
CHASSIS: C46.1 C52.1 C65.2 J2.S1(SHIELD1) J2.S2(SHIELD2) R34.2
MDI_RXN: D3.5(D2-) T1.8(RD-) U5.4(RD_M)
MDI_RXP: D3.4(D2+) T1.6(RD+) U5.5(RD_P)
MDI_TXN: D3.2(D1-) T1.3(TD-) U5.6(TD_M)
MDI_TXP: D3.1(D1+) T1.1(TD+) U5.7(TD_P)
RX+: J2.3 T1.11(RX+)
RX-: J2.6 T1.9(RX-)
TX+: J2.1 T1.16(TX+)
TX-: J2.2 T1.14(TX-)
XI: U5.9(XI/50MHzIn) Y2.3(OUT_25MHz)
NetC37_1: C37.1 U5.2(CEXT)
NetC42_1: C42.1 C43.1 T1.2(TCT)
NetC44_1: C44.1 C45.1 T1.7(RCT)
NetC46_2: C46.2 R12.2 R14.2
NetC52_2: C52.2 R17.2 R19.1
NetD4_1: R35.2 U6.7(B) ; port B
NetD4_2: R35.1 U6.6(A) ; port A
NetJ2_4: J2.4 J2.5 R19.2
NetJ2_7: J2.7 J2.8 R17.1
NetJ10_1: R36.2 U7.7(CANH) ; port CANH
NetJ10_2: R36.1 U7.6(CANL) ; port CANL
NetR12_1: R12.1 T1.10(CMT_RX)
NetR13_2: R13.2 U5.10(RBIAS)
NetR14_1: R14.1 T1.15(CMT_TX)
NetR15_2: R15.2 U5.14(RX_D2)
NetR16_1: R16.1 U6.2(/RE) ; port RS485_nRE
NetR18_2: R18.2 U6.3(DE) ; port RS485_DE
NetU4_5: U5.32(RST_N) ; port PHY_nRESET
NetU4_16: U5.12(MDC) ; port ETH_MDC
NetU4_23: U5.19(RX_CLK/50MHz_RMII) ; port ETH_RMII_REF_CLK
NetU4_24: U5.11(MDIO) ; port ETH_MDIO
NetU4_31: U5.18(RX_DV/CRS_DV) ; port ETH_RMII_CRS_DV
NetU4_32: U5.16(RX_D0) ; port ETH_RMII_RXD0
NetU4_33: U5.15(RX_D1) ; port ETH_RMII_RXD1
NetU4_37: U7.8(STBY) ; port CAN_STBY
NetU4_47: U5.23(TX_EN) ; port ETH_RMII_TX_EN
NetU4_51: U5.24(TX_D0) ; port ETH_RMII_TXD0
NetU4_52: U5.25(TX_D1) ; port ETH_RMII_TXD1
NetU4_55: U6.4(D) ; port USART3_TX
NetU4_56: U6.1(R) ; port USART3_RX
NetU4_81: U7.4(RXD) ; port FDCAN1_RX
NetU4_82: U7.1(TXD) ; port FDCAN1_TX

Not connected (* = marked no-connect by the designer): D3 6(NC)* 7(NC)* 9(NC)* 10(NC)*; T1 4(NC)* 5(NC)* 12(NC)* 13(NC)*; U5 1(ModeSelect)* 8(XO)* 13(RX_D3)* 20(RX_ER)* 21(PWRDN/INT)* 22(TX_CLK)* 26(TX_D2)* 27(TX_D3)* 28(COL/LED2/TX_ER/GPIO)* 29(CRS/LED3)* 30(LED0)* 31(CLKOUT/LED1)*

### Library data of the parts
C36 C38 C47 = GW_C0603C103K1RACTU_97f3ee33: as C25 on sheet MCU; Manufacturer Part Number: C0603C103K1RACTU; Value: 10 nF; Rating: 100 V; X7R; -55..125 C; Power Rating: N/A; Package: 0603; CAD_Status: CAD_CANDIDATE
C37 = GW_C0603C202J5GACTU_fa733a70: C0603C202J5GACTU; 2 nF; 50 V; C0G; CAD_CANDIDATE; Manufacturer: KEMET; Tolerance: 5% seleccion; Electrical_Status: PROVISIONAL; CAD_Source: Professor_shared.SchLib glyph Cap_0.1uF_0603_50V; CAD_Limitations: Glyph pins/types inspected; exact manufacturer land-pattern/mask/paste qualification pending.; Electrical_Notes: Conflicto EVM C57=100 nF; prevalece requisito actual 2 nF, no copiar C57. Modelo candidato existente; sin cotejo visual de pads/pines en Altium.; Manufacturer Part Number: C0603C202J5GACTU; Value: 2 nF; Rating: 50 V; C0G; Power Rating: N/A; Package: 0603; CAD_Status: CAD_CANDIDATE
C39 C42-C45 C48 C51 C53 C54 = GW_C0603C104K5RACTU_dc5e12a5: as C22 on sheet MCU; Manufacturer Part Number: C0603C104K5RACTU; Value: 100 nF; Rating: 50 V; X7R; -55..125 C; Power Rating: N/A; Package: 0603; CAD_Status: CAD_CANDIDATE
C40 C49 = GW_CL10A105KB8NNNC_c3932faa: as C23 on sheet MCU; Manufacturer Part Number: CL10A105KB8NNNC; Value: 1 uF; Rating: 50 V; X5R; -55..85 C; Power Rating: N/A; Package: 0603; CAD_Status: CAD_CANDIDATE
C41 C50 = GW_CL21A106KAYNNNE_c6e24382: CL21A106KAYNNNE; 10 uF; 25 V; X5R; -55..85 C; CAD_CANDIDATE; Manufacturer: Samsung Electro-Mechanics; Tolerance: 10%; Electrical_Status: PROVISIONAL; CAD_Source: Professor_shared.SchLib glyph Cap_10uF_0805_25V_; CAD_Limitations: Glyph pins/types inspected; exact manufacturer land-pattern/mask/paste qualification pending.; Electrical_Notes: Ceff a 3.3 V y temperatura pendientes. No usar para entrada 30 V. Modelo candidato existente; sin cotejo visual de pads/pines en Altium.; Manufacturer Part Number: CL21A106KAYNNNE; Value: 10 uF; Rating: 25 V; X5R; -55..85 C; Power Rating: N/A; Package: 0805; CAD_Status: CAD_CANDIDATE
C46 C52 C65 = C1206C102KGRACAUTO: KEMET1nF10%2kVDCX7R1206; Ethernet chassis AC return; no safety-Y or surge claim; Manufacturer: KEMET; Value: 1 nF; Tolerance: 10%; Voltage Rating: 2000 VDC; Dielectric: X7R; CAD Status: CAD_VERIFIED; Electrical Approval: PROVISIONAL_APPLICATION, not safety-Y certified; Electrical Test: NOT_TESTED; Assembly: JLC Extended observed2026-11-07, quantity unknown, no stock reservation; Manufacturer Part Number: C1206C102KGRACAUTO; Package: 1206 /3216; Datasheet: sources/ethernet_1nf/C600002.pdf; Source: KEMET C1076_X7R_HV_AUTO_SMD9/10/2019 pp1-2 ordering/rating,p4 body,p10 Table3 densityB1206, C600002 exact catalog identity; LCSC Part Number: C600002; Terminal Mapping: Nonpolar, project1-left/2-right, symbol1->pad1,2->pad2
D3 = TPD4E05U06DQAR: TI SLVSBO7O table4-2 p4; DQA0010A 4220328/A board/stencil pp29-30; PHY-side only, per DP83826EVM sheet3. GND3/8 to logic GND. NC6/7/9/10 may be pass-through pads; preserve isolation.; Manufacturer: Texas Instruments; CAD Status: CAD_CANDIDATE; Manufacturer Part Number: TPD4E05U06DQAR; Source: TI SLVSBO7O table4-2 p4; DQA0010A 4220328/A board/stencil pp29-30; Limitations: PHY-side only, per DP83826EVM sheet3. GND3/8 to logic GND. NC6/7/9/10 may be pass-through pads; preserve isolation.
J2 = SS-7188S-A-NF: Cinch/Stewart CT710001 revB0 10-Jul-2023 component-side recommended hole layout; Numbered contacts per component-side drawing. S1/S2 are project labels for unnumbered shield tabs; MP1/2 are non-electrical mounting holes. Candidate copper lands; sourcing risk separate.; CAD Status: CAD_CANDIDATE; Manufacturer: Cinch / Stewart; Manufacturer Part Number: SS-7188S-A-NF; Source: Cinch/Stewart CT710001 revB0 10-Jul-2023 component-side recommended hole layout; Limitations: Numbered contacts per component-side drawing. S1/S2 are project labels for unnumbered shield tabs; MP1/2 are non-electrical mounting holes. Candidate copper lands; sourcing risk separate.
R12 R14 R17 R19 = CRCW080575R0FKEA: 75Ohm1%0.125W0805 Vishay D/CRCW e3; Ethernet cable termination; not C-suffix commodity variant; Value: 75 Ohm; Tolerance: 1%; Power Rating: 0.125 W at70C, derating applies; TCR: 100 ppm/K; Local Datasheet: sources/ethernet_75ohm/C844859.pdf; CAD Status: CAD_VERIFIED; Design Approval: RETAINED_ORIGINAL_SELECTION; Electrical Test: NOT_TESTED; Assembly: JLC Extended observed, quantity unknown, verify before ordering; Manufacturer: Vishay; Manufacturer Part Number: CRCW080575R0FKEA; Package: 0805 /2012; Datasheet: https://www.vishay.com/docs/20035/dcrcwe3.pdf; Source: Vishay20035 Rev18-Jun-2018 p3 ordering, p9 body/reflow lands, JLC C844859 exact identity observed2026-11-07; LCSC Part Number: C844859; Terminal Mapping: Nonpolar resistor: project pin1=left pad1,pin2=right pad2
R13 = GW_RC0603FR-076K49L_f42a9329: RC0603FR-076K49L; 6.49 kOhm; 75 V max; limite sqrt(P*R); CAD_CANDIDATE; Manufacturer: Yageo; Tolerance: 1%; Power Rating: 0.1 W @70 C; Electrical_Status: PROVISIONAL; CAD_Source: Professor_shared.SchLib glyph Res_10k_0603_1/10W; CAD_Limitations: Glyph pins/types inspected; exact manufacturer land-pattern/mask/paste qualification pending.; Electrical_Notes: P<3.3^2/6490=1.68 mW; actualizacion de valor/MPN sobre simbolo generico pendiente. Modelo candidato existente; sin cotejo visual de pads/pines en Altium.; Manufacturer Part Number: RC0603FR-076K49L; Value: 6.49 kOhm; Rating: 75 V max; limite sqrt(P*R); Package: 0603; CAD_Status: CAD_CANDIDATE
R15 = GW_RC0603FR-072K49L_b905c5f0: RC0603FR-072K49L; 2.49 kOhm; 75 V max; limite sqrt(P*R); CAD_CANDIDATE; Manufacturer: Yageo; Tolerance: 1%; Power Rating: 0.1 W @70 C; Electrical_Status: PROVISIONAL; CAD_Source: Professor_shared.SchLib glyph Res_10k_0603_1/10W; CAD_Limitations: Glyph pins/types inspected; exact manufacturer land-pattern/mask/paste qualification pending.; Electrical_Notes: Candidato ENHANCED/RMII leader: ModeSelect NC, strap1=1 default, strap8=1, strap5=0 default. Ver tabla del informe; sin LEDs de straps. Modelo candidato existente; sin cotejo visual de pads/pines en Altium.; Manufacturer Part Number: RC0603FR-072K49L; Value: 2.49 kOhm; Rating: 75 V max; limite sqrt(P*R); Package: 0603; CAD_Status: CAD_CANDIDATE
R16 R18 = GW_FRC0603J103TS_7289f91d: as R11 on sheet MCU; Manufacturer Part Number: FRC0603J103TS; Value: 10 kOhm; Rating: >= 3.3 V; tension de trabajo por verificar; Package: 0603; CAD_Status: CAD_CANDIDATE
R34 = RC0603FR-0710KL: Existing exact Yageo RC0603FR-0710KL sheet p1; AN5419 boot example; TI SLLSF78B section10.1; 10kOhm1%0.1W@70C; replaces unqualified FOJAN identity. Shared professor lands remain CAD_CANDIDATE, not qualified manufacturer lands.; CAD Status: CAD_VERIFIED_SOURCE_LAND;NATIVE_INSTANCE_ECO_PENDING; Limitations: Same-manufacturer series mounting geometry verified; prototype mask/paste choices recorded. Electrical application limits unchanged. Native instance links/ECO pending.; Manufacturer: Yageo; Manufacturer Part Number: RC0603FR-071ML; Source: Yageo RC_L product specification V.11 (2020), Table 2 p5
R35 R36 = CRCW1206120RFKEA: Vishay D/CRCW e3 family20035;120ohm1%0.25W1206; optional bus-end termination,open-default jumper.; Value: 120 Ohm; CAD Status: CAD_VERIFIED_GEOMETRY;NATIVE_PLACEMENT_PENDING; Electrical Status: DERIVED_PENDING_REVIEW;END_NODE_ONLY;STOCK_UNVERIFIED; Tolerance: 1%; Power Rating: 0.25W at70C; Manufacturer: Vishay; Manufacturer Part Number: CRCW1206120RFKEA; Source: Vishay20035 family ordering/power;18Jun2018p9 REFLOW1206 lands; Package: 1206; Datasheet: sources/ethernet_75ohm/C844859.pdf
T1 = HX1188FNL: Pulse HX1188FNL revB 30-May-2014 sheets2-3 PS-2005.002-D; Use exact winding map; NC4,5,12,13 remain unconnected. FNLT is packaging variant; selected MPN FNL.; Manufacturer: Pulse Electronics; CAD Status: CAD_CANDIDATE; Manufacturer Part Number: HX1188FNL; Source: Pulse HX1188FNL revB 30-May-2014 sheets2-3 PS-2005.002-D; Limitations: Use exact winding map; NC4,5,12,13 remain unconnected. FNLT is packaging variant; selected MPN FNL.
U5 = DP83826IRHBR: DP83826IRHBR; CAD_CANDIDATE; Multi-function strap pins conservatively bidirectional. Mode not frozen. EP33 must be soldered to ground; thermal vias are board-level optional, filled/plugged/tented if under paste.; Manufacturer: Texas Instruments; Electrical_Status: PROVISIONAL; CAD_Source: SNLS647I table5-1 pp5-6; exposed pad p7; RHB0032M 4223725/A PDF pp111-113; Manufacturer Part Number: DP83826IRHBR; Value: DP83826IRHBR; CAD_Status: CAD_CANDIDATE; CAD_Limitations: Multi-function strap pins conservatively bidirectional. Mode not frozen. EP33 must be soldered to ground; thermal vias are board-level optional, filled/plugged/tented if under paste.
U6 = THVD1420DR: THVD1420DR; CAD_CANDIDATE;; Manufacturer: Texas Instruments; Electrical_Status: PROVISIONAL; CAD_Source: SLLSF78B table4-1 p3; D0008A 4214825/C PDF pp30-32; CAD_Limitations: Circuit not electrically released.; Manufacturer Part Number: THVD1420DR; Value: THVD1420DR; CAD_Status: CAD_CANDIDATE
U7 = ATA6561-GAQW: ATA6561-GAQW; CAD_CANDIDATE;; Manufacturer: Microchip; Electrical_Status: PROVISIONAL; CAD_Source: DS20005991B pin table p3; C04-2057-OA RevE p19; CAD_Limitations: Circuit not electrically released.; Manufacturer Part Number: ATA6561-GAQW; Value: ATA6561-GAQW; CAD_Status: CAD_CANDIDATE
Y2 = KC2016Z25.0000C15XXK: as Y1 on sheet MCU; Manufacturer: Kyocera; Manufacturer Part Number: KC2016Z25.0000C15XXK; Source: Kyocera TNY1T-H1-DEX01-11 17-Jul-2026 pp4,6 table2 fig4; Limitations: Two independent oscillators proposed; 10nF per supply. Tie1 to3V3. Load<=15pF and PHY phase-noise qualification pending.